# Altium schematic sheet Main.SchDoc
size A4; SheetNumber: 1; SheetTotal: 5
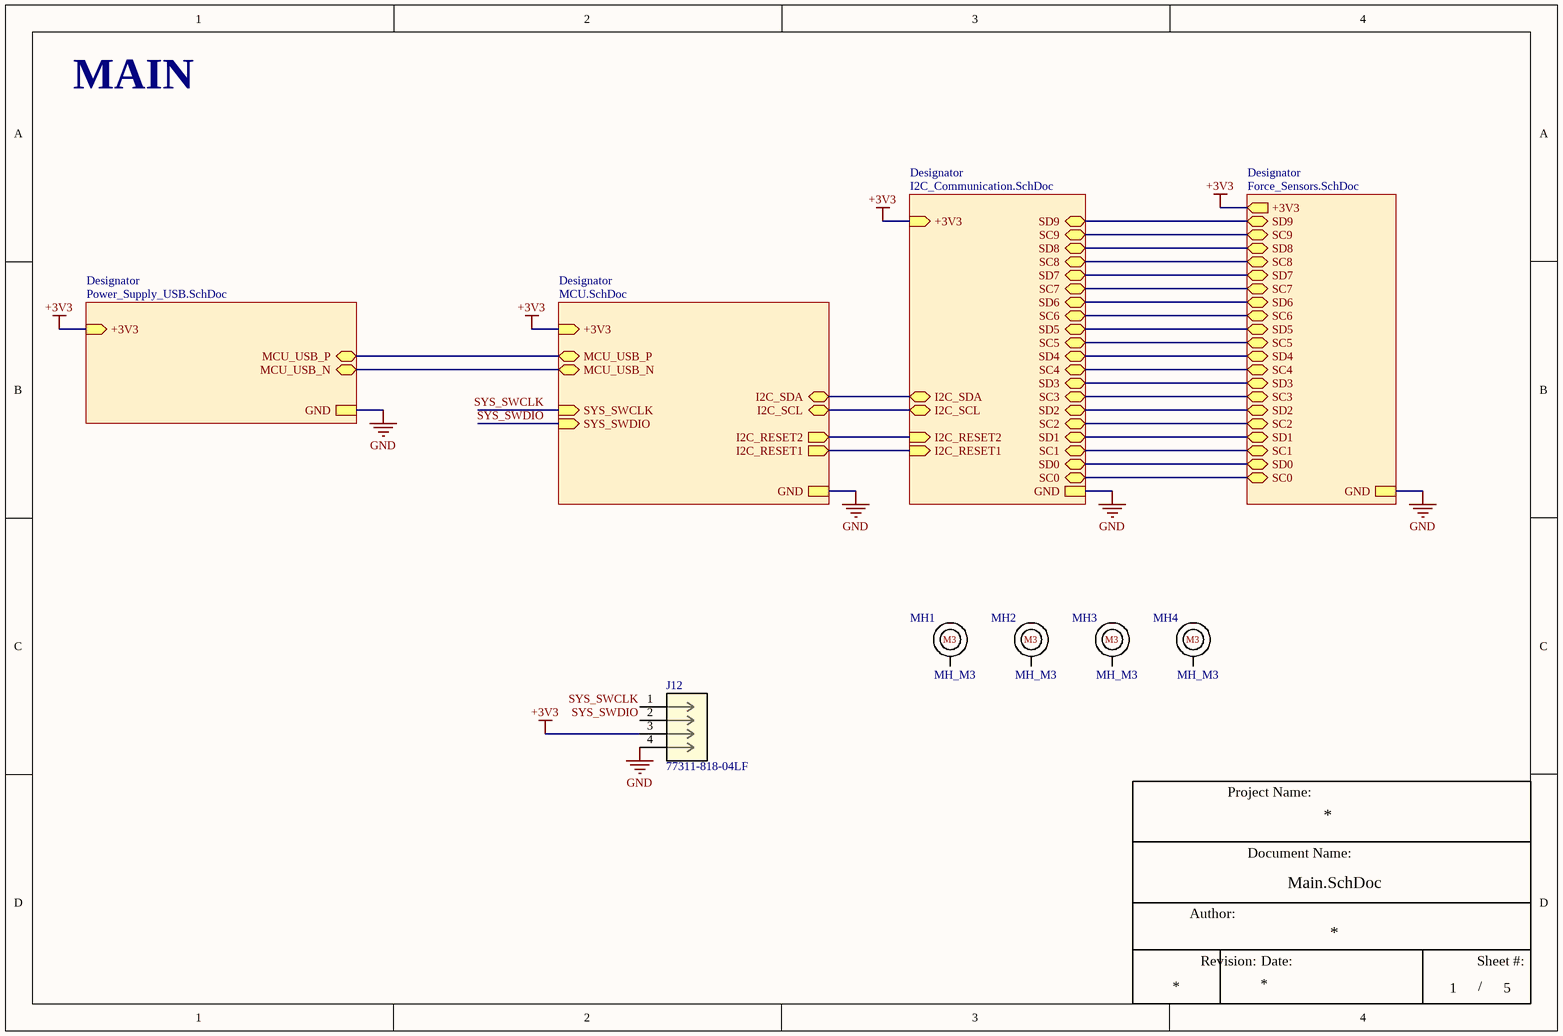
[diagram p0: Main.SchDoc]

## Parts
J12  77311-818-04LF  [77311-818-04LF_AMP]
MH1  MH_M3  [M3]  (no BOM)
MH2  MH_M3  [M3]  (no BOM)
MH3  MH_M3  [M3]  (no BOM)
MH4  MH_M3  [M3]  (no BOM)

## Sub-sheets
Designator = Force_Sensors.SchDoc: GND, +3V3 (out), SC9 (bidir), SD8 (bidir), SC8 (bidir), SD7 (bidir), SC7 (bidir), SD6 (bidir), SC6 (bidir), SD5 (bidir), SC5 (bidir), SD4 (bidir), SC4 (bidir), SD3 (bidir), SC3 (bidir), SD2 (bidir), SC2 (bidir), SD1 (bidir), SC1 (bidir), SD0 (bidir), SC0 (bidir), SD9 (bidir)
Designator = Power_Supply_USB.SchDoc: GND, +3V3 (in), MCU_USB_P (bidir), MCU_USB_N (bidir)
Designator = MCU.SchDoc: I2C_SDA (bidir), I2C_SCL (bidir), SYS_SWCLK (in), +3V3 (in), SYS_SWDIO (in), I2C_RESET1 (out), I2C_RESET2 (out), GND, MCU_USB_P (bidir), MCU_USB_N (bidir)
Designator = I2C_Communication.SchDoc: GND, +3V3 (in), I2C_SDA (bidir), I2C_SCL (bidir), I2C_RESET2 (in), I2C_RESET1 (in), SC9 (bidir), SD8 (bidir), SC8 (bidir), SD2 (bidir), SD7 (bidir), SC3 (bidir), SD3 (bidir), SC4 (bidir), SD4 (bidir), SC5 (bidir), SD5 (bidir), SC6 (bidir), SD6 (bidir), SC7 (bidir), SC2 (bidir), SD1 (bidir), SC1 (bidir), SD0 (bidir), SC0 (bidir), SD9 (bidir)

## Nets
+3V3: J12.3 ; sheet Designator/+3V3, sheet Designator/+3V3, sheet Designator/+3V3, sheet Designator/+3V3
GND: J12.4 ; sheet Designator/GND, sheet Designator/GND, sheet Designator/GND, sheet Designator/GND
SYS_SWCLK: J12.1 ; sheet Designator/SYS_SWCLK
SYS_SWDIO: J12.2 ; sheet Designator/SYS_SWDIO
(unnamed): sheet Designator/SC9, sheet Designator/SC9
(unnamed): sheet Designator/SD8, sheet Designator/SD8
(unnamed): sheet Designator/SC8, sheet Designator/SC8
(unnamed): sheet Designator/SD7, sheet Designator/SD7
(unnamed): sheet Designator/SC7, sheet Designator/SC7
(unnamed): sheet Designator/SD6, sheet Designator/SD6
(unnamed): sheet Designator/SC6, sheet Designator/SC6
(unnamed): sheet Designator/SD5, sheet Designator/SD5
(unnamed): sheet Designator/SC5, sheet Designator/SC5
(unnamed): sheet Designator/SD4, sheet Designator/SD4
(unnamed): sheet Designator/SC4, sheet Designator/SC4
(unnamed): sheet Designator/SD3, sheet Designator/SD3
(unnamed): sheet Designator/SC3, sheet Designator/SC3
(unnamed): sheet Designator/SD2, sheet Designator/SD2
(unnamed): sheet Designator/SC2, sheet Designator/SC2
(unnamed): sheet Designator/SD1, sheet Designator/SD1
(unnamed): sheet Designator/SC1, sheet Designator/SC1
(unnamed): sheet Designator/SD0, sheet Designator/SD0
(unnamed): sheet Designator/SC0, sheet Designator/SC0
(unnamed): sheet Designator/SD9, sheet Designator/SD9
(unnamed): sheet Designator/MCU_USB_P, sheet Designator/MCU_USB_P
(unnamed): sheet Designator/MCU_USB_N, sheet Designator/MCU_USB_N
(unnamed): sheet Designator/I2C_SDA, sheet Designator/I2C_SDA
(unnamed): sheet Designator/I2C_SCL, sheet Designator/I2C_SCL
(unnamed): sheet Designator/I2C_RESET1, sheet Designator/I2C_RESET1
(unnamed): sheet Designator/I2C_RESET2, sheet Designator/I2C_RESET2

Not connected (* = marked no-connect by the designer): MH1 1; MH2 1; MH3 1; MH4 1

## Notes on the sheet
- MAIN
- Project Name:
- Author:
- Document Name:
- Revision:
- Date:
- Sheet #:
- /

## Library data of the parts
J12 = 77311-818-04LF: Description; Manufacturer_Name: Amphenol ICC; Copyright: Copyright (C) 2025 Ultra Librarian. All rights reserved.; Manufacturer_Part_Number: 77311-818-04LF; RefDes: RefDes; Type: Type
MH1-MH4 = CMP-00028-00002-1: Mounting hole; M3 Screw; 3.4mm x 4.3mm; Revision Num.: 1; Man. Part Num.: M3; Diameter: 4.3mm; Hole size: 3.4mm